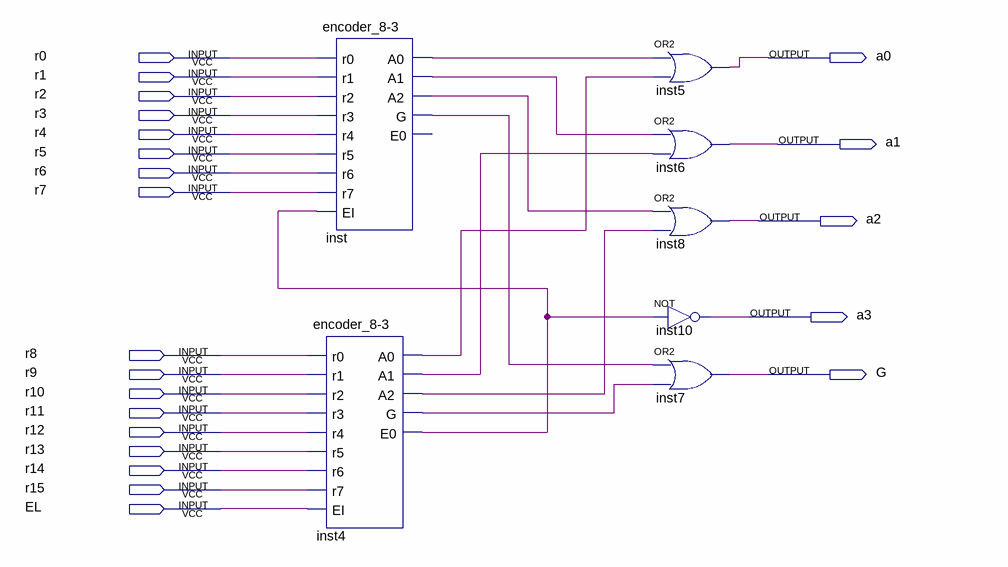
[diagram p0: schematic sheet]
// Quartus schematic encoder_16-4.bdf as structural Verilog: 7 symbols, 22 pins
module \encoder_16-4  (
  input  r0,
  input  r1,
  input  r2,
  input  r3,
  input  r4,
  input  r5,
  input  r6,
  input  r7,
  input  r8,
  input  r9,
  input  r10,
  input  r11,
  input  r12,
  input  r13,
  input  r14,
  input  r15,
  input  EL,
  output a0,
  output a1,
  output a2,
  output a3,
  output G
);

  wire inst4_a0, inst4_a1, inst4_a2, inst4_e0, inst4_g, inst_a0, inst_a1, inst_a2, inst_g;

  \encoder_8-3  inst (
    .r0(r0), .r1(r1), .r2(r2), .r3(r3), .r4(r4), .r5(r5), .r6(r6), .r7(r7), .EI(inst4_e0), .A0(inst_a0),
    .A1(inst_a1), .A2(inst_a2), .G(inst_g));  // open: E0
  \encoder_8-3  inst4 (
    .r0(r8), .r1(r9), .r2(r10), .r3(r11), .r4(r12), .r5(r13), .r6(r14), .r7(r15), .EI(EL), .A0(inst4_a0),
    .A1(inst4_a1), .A2(inst4_a2), .G(inst4_g), .E0(inst4_e0));
  or inst5 (a0, inst_a0, inst4_a0);
  or inst6 (a1, inst_a1, inst4_a1);
  or inst8 (a2, inst_a2, inst4_a2);
  not inst10 (a3, inst4_e0);
  or inst7 (G, inst_g, inst4_g);
endmodule
